# EasyEDA Pro project 物流车.epro, schematic Schematic1
Board Name: Board1; Create Date: 2026-05-04; Page Name: P1; Project Name: 集成板; Schematic Name: Schematic1; Update Date: 2026-05-04; Add into BOM: yes; Company: 嘉立创EDA; Convert to PCB: yes; Page Size: A4; Version: V1.0
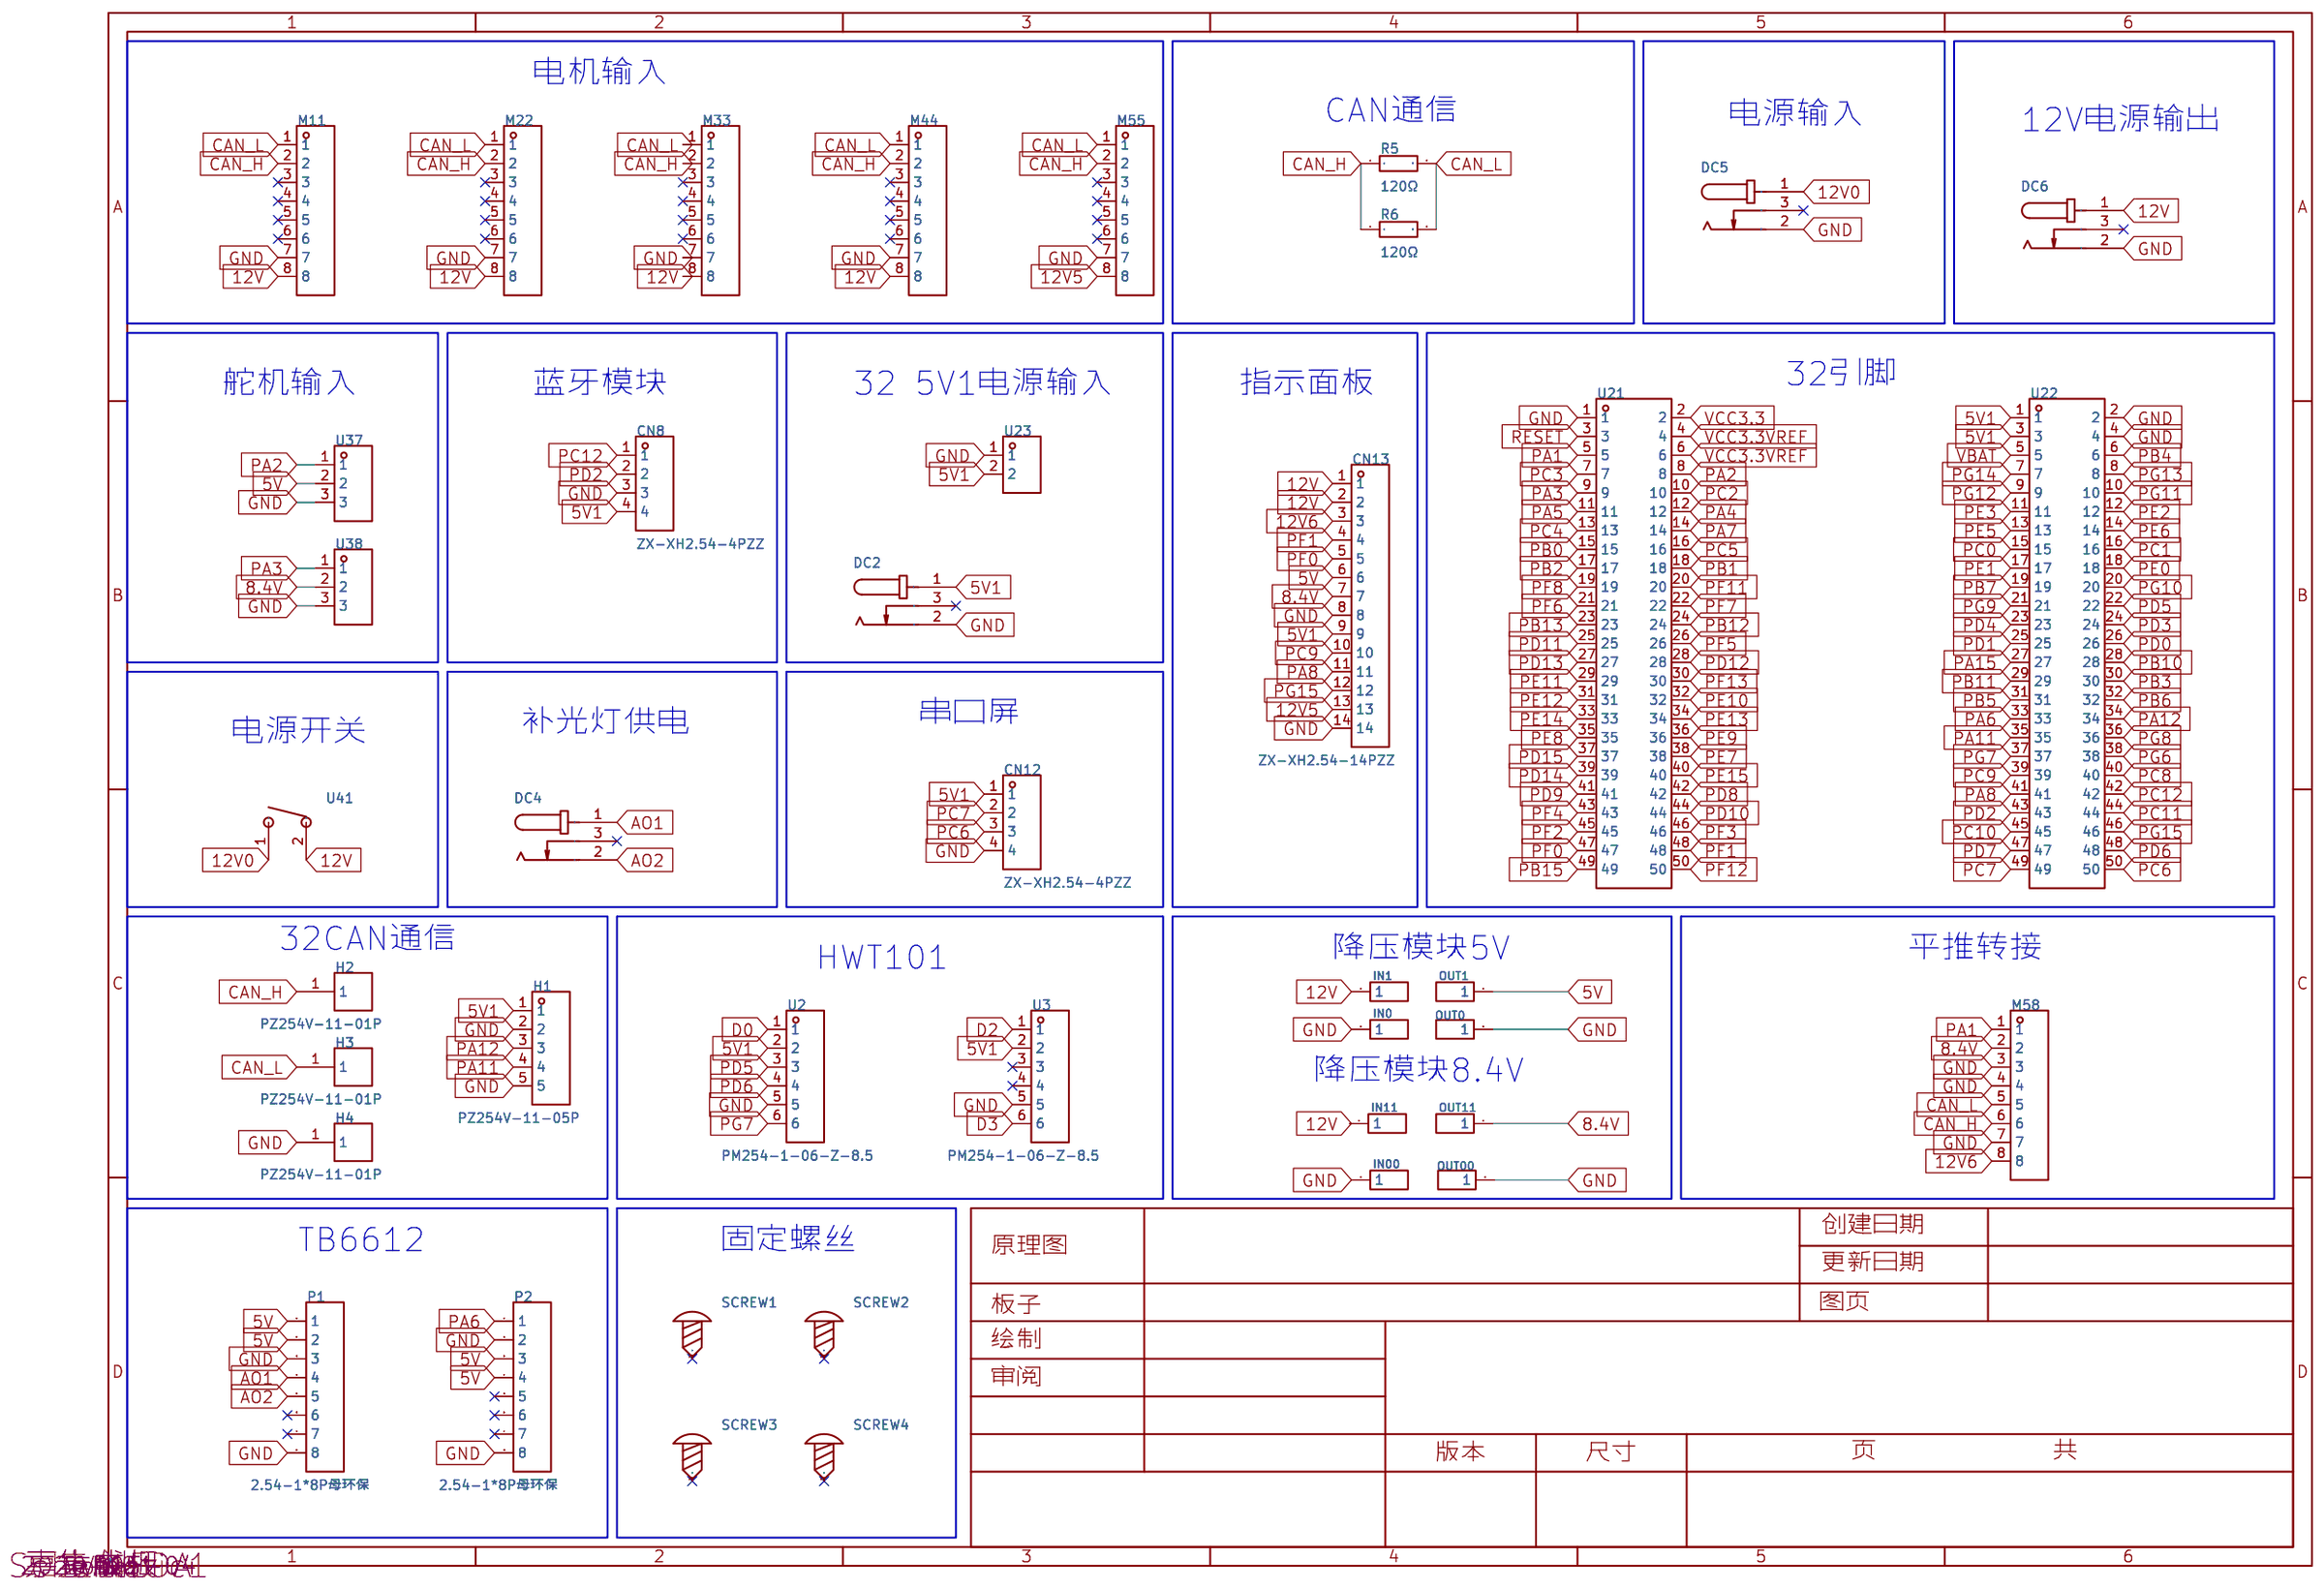
[diagram p0: schematic sheet]

## Parts
CN8  ZX-XH2.54-4PZZ  [CONN-TH_4P-P2.50_4PIN]
CN12  ZX-XH2.54-4PZZ  [CONN-TH_4P-P2.50_4PIN]
CN13  ZX-XH2.54-14PZZ  [CONN-TH_14P-P2.50_ZX-XH2.54-14PZZ]
DC2  DC-005-A200  [DC-IN-TH_DC-005-A200]
DC4  DC-005-A200  [DC-IN-TH_DC-005-A200]
DC5  DC-005-A200  [DC-IN-TH_DC-005-A200]
DC6  DC-005-A200  [DC-IN-TH_DC-005-A200]
H1  PZ254V-11-05P  [HDR-TH_5P-P2.54-V-M]
H2  PZ254V-11-01P  [HDR-TH_1P-P2.54-V-M]
H3  PZ254V-11-01P  [HDR-TH_1P-P2.54-V-M]
H4  PZ254V-11-01P  [HDR-TH_1P-P2.54-V-M]
IN0  2.54-1*1P针  [HDR-TH_1P-P2.54-V-M]
IN00  2.54-1*1P针  [HDR-TH_1P-P2.54-V-M]
IN1  2.54-1*1P针  [HDR-TH_1P-P2.54-V-M]
IN11  2.54-1*1P针  [HDR-TH_1P-P2.54-V-M]
M11  ZX-XH2.54-8PZZ  [CONN-TH_8P-P2.50-XH2.54-8P]
M22  ZX-XH2.54-8PZZ  [CONN-TH_8P-P2.50-XH2.54-8P]
M33  ZX-XH2.54-8PZZ  [CONN-TH_8P-P2.50-XH2.54-8P]
M44  ZX-XH2.54-8PZZ  [CONN-TH_8P-P2.50-XH2.54-8P]
M55  ZX-XH2.54-8PZZ  [CONN-TH_8P-P2.50-XH2.54-8P]
M58  ZX-XH2.54-8PZZ  [CONN-TH_8P-P2.50-XH2.54-8P]
OUT0  2.54-1*1P针  [HDR-TH_1P-P2.54-V-M]
OUT00  2.54-1*1P针  [HDR-TH_1P-P2.54-V-M]
OUT1  2.54-1*1P针  [HDR-TH_1P-P2.54-V-M]
OUT11  2.54-1*1P针  [HDR-TH_1P-P2.54-V-M]
P1  2.54-1*8P母环保  [HDR-TH_8P-P2.54-V-F-1]
P2  2.54-1*8P母环保  [HDR-TH_8P-P2.54-V-F-1]
R5  120Ω  [R0805]
R6  120Ω  [R0805]
SCREW1  -  [M3螺丝]
SCREW2  -  [M3螺丝]
SCREW3  -  [M3螺丝]
SCREW4  -  [M3螺丝]
U2  PM254-1-06-Z-8.5  [hdr-th_6p-p2.54-v-f]
U3  PM254-1-06-Z-8.5  [hdr-th_6p-p2.54-v-f]
U21  ZX-PM2.54-2-25PY  [HDR-TH_50P-P2.54-V-F-R2-C25-S2.54-1]
U22  ZX-PM2.54-2-25PY  [HDR-TH_50P-P2.54-V-F-R2-C25-S2.54-1]
U23  WAFER-PH2.0-2PZZ  [CONN-TH_2P-P2.00_HC-PH-2A-M]
U37  HB-PH3-25413PB2GOP  [HDR-TH_3P-P2.54-V-M]
U38  HB-PH3-25413PB2GOP  [HDR-TH_3P-P2.54-V-M]
U41  SS11-RBIWG-R20-R  [sw-th_l21.0-w15.0_ss11-rbiwg-r20-r]

## Library data of the parts
CN8 CN12 = ZX-XH2.54-4PZZ: 插针结构:1x4P;间距:2.54mm;安装方式:直插;参考系列:XH;总PIN数:4P;排数:1;每排PIN数:4;行距:-;额定电流:3A;触头材质:黄铜;触头镀层:锡;工作温度范围:-25℃~+85℃;; Supplier Part: C7429634; Manufacturer: Megastar(兆星); Supplier Footprint: 插件,P=2.54mm; JLCPCB Part Class: 扩展库; Datasheet: https://atta.szlcsc.com/upload/public/pdf/source/20230619/B529A2163E0159A644AB3383D208FB03.pdf; Supplier: LCSC; Pins Structure: 1x4P; Pitch: 2.54mm; Mounting Style: 直插; Reference Series: XH; Number of Pins: 4P; Number of Rows: 1; Number of PINs Per Row: 4; Current Rating (Max): 3A; Contact Material: 黄铜; Contact Plating: 锡; Operating Temperature Range: -25℃~+85℃
CN13 = ZX-XH2.54-14PZZ: 插针结构:1x14P;间距:2.5mm;安装方式:直插;参考系列:XH;总PIN数:14P;排数:1;每排PIN数:14;行距:-;额定电流:3A;触头材质:黄铜;触头镀层:锡;工作温度范围:-25℃~+85℃;; LCSC Part Name: 1x14P 间距:2.5mm 直插 系列:XH; Supplier Part: C22366170; Manufacturer: Megastar(兆星); Supplier Footprint: 插件,P=2.54mm; JLCPCB Part Class: 扩展库; Datasheet: https://atta.szlcsc.com/upload/public/pdf/source/20240326/867C2E693C2B8D00E51A366B538343B4.pdf; Supplier: LCSC; Pins Structure: 1x14P; Pitch: 2.5mm; Mounting Type: 直插; Reference Series: XH; Number of Pins: 14P; Number of Rows: 1; Number of PINs Per Row: 14; Rated Current: 3A; Contact Material: 黄铜; Contact Plating: 锡; Operating Temperature: -25℃~+85℃; Rated Voltage (Max): 250V; Plastic Material: PA66; Flame Retardant Rating: UL94V-0; Color: 白色; Z-Height of the Board: 7mm; X-Length of Bottom Edge on Board (Spacing Line): 37.5mm; Y-Width of Bottom Edge on Board: 5.9mm
DC2 DC4-DC6 = DC-005-A200: 连接器类型:DC电源插座;安装方式:弯插;触点内径:2mm;触点外径:6.4mm;额定电流:3A;额定电压:30V;工作温度范围:-20℃~+70℃;; LCSC Part Name: DC电源插座 内径:2mm 外径:6.4mm; Supplier Part: C720557; Manufacturer: XUNPU(讯普); Supplier Footprint: 插件; Datasheet: https://atta.szlcsc.com/upload/public/pdf/source/20200812/C720557_2286DFCD6C75B71AF905731F627ABF3A.pdf; Supplier: LCSC; Connector Type: DC电源插座; Mounting Style: 弯插; Inside Contact Diameter: 2mm; Outside Contact Diameter: 6.4mm; Current Rating (Max): 3A; Voltage Rating (Max): 30V; Operating Temperature Range: -20℃~+70℃
H1 = PZ254V-11-05P: 插针结构:1x5P;间距:2.54mm;行距:-;圆针/方针:方针;安装类型:直插;排数:单排;总PIN位数:5P;额定电流:-;额定电压:-;配合针长度:6mm;塑高:2.5mm;端接针长度:3mm;触头材质:黄铜;触头镀层:-;工作温度范围:-40℃~+105℃;颜色:黑色;; LCSC Part Name: 间距:2.54mm 1x5P 直插 方针; Supplier Part: C492404; Manufacturer: XFCN(兴飞); Supplier Footprint: 插件,P=2.54mm; Datasheet: https://atta.szlcsc.com/upload/public/pdf/source/20200309/C492404_E51533260F8710EFF5D4617281164C1D.pdf; Supplier: LCSC; Pin Structure: 1x5P; Pitch: 2.54mm; Circluar Pins/Square Pins: 方针; Mounting Type: 直插; Number of Rows: 单排; Number of Pins: 5P; Length of Mating Pin: 6mm; Insulation Height: 2.5mm; Length of End Connection Pin: 3mm; Contact Material: 黄铜; Operating Temperature Range: -40℃~+105℃; Color: 黑色
H2-H4 = PZ254V-11-01P: 插针结构:1x1P;间距:2.54mm;行距:-;圆针/方针:方针;安装类型:直插;排数:单排;总PIN位数:1P;额定电流:-;额定电压:-;配合针长度:6mm;塑高:2.5mm;端接针长度:3mm;触头材质:黄铜;触头镀层:-;工作温度范围:-40℃~+105℃;颜色:黑色;; LCSC Part Name: 间距:2.54mm 1x1P 直插 方针; Supplier Part: C492400; Manufacturer: XFCN(兴飞); Supplier Footprint: 插件,P=2.54mm; Datasheet: https://atta.szlcsc.com/upload/public/pdf/source/20200309/C492400_46876A5B545F5AE6B8D4A09C46E276E8.pdf; Supplier: LCSC; Pin Structure: 1x1P; Pitch: 2.54mm; Circluar Pins/Square Pins: 方针; Mounting Type: 直插; Number of Rows: 单排; Number of Pins: 1P; Length of Mating Pin: 6mm; Insulation Height: 2.5mm; Length of End Connection Pin: 3mm; Contact Material: 黄铜; Operating Temperature Range: -40℃~+105℃; Color: 黑色
IN0 IN00 IN1 IN11 OUT0 OUT00 OUT1 OUT11 = 2.54-1*1P针: 插针结构:-;间距:-;行距:-;圆针/方针:-;安装类型:直插;排数:单排;总PIN位数:1P;额定电流:-;额定电压:-;配合针长度:-;塑高:-;触头材质:-;触头镀层:-;颜色:黑色;; LCSC Part Name: 直插; Supplier Part: C81276; Manufacturer: BOOMELE(博穆精密); Supplier Footprint: 插件,P=2.54mm; JLCPCB Part Class: 扩展库; Datasheet: https://atta.szlcsc.com/upload/public/pdf/source/20221018/3E9408392E35E6F57A28985E5F7BF5C9.pdf; Supplier: LCSC; Mounting Type: 直插; Number of Rows: 单排; Number of Pins: 1P; Color: 黑色
M11 M22 M33 M44 M55 M58 = ZX-XH2.54-8PZZ: 插针结构:1x8P;间距:2.54mm;安装方式:直插;参考系列:XH;总PIN数:8P;排数:1;每排PIN数:8;行距:-;额定电流:3A;触头材质:黄铜;触头镀层:锡;工作温度范围:-25℃~+85℃;; Supplier Part: C7429638; Manufacturer: Megastar(兆星); Supplier Footprint: 插件,P=2.54mm; JLCPCB Part Class: 扩展库; Datasheet: https://atta.szlcsc.com/upload/public/pdf/source/20230619/688603DEA58996C00B1F33C46797D2C3.pdf; Supplier: LCSC; Pins Structure: 1x8P; Pitch: 2.54mm; Mounting Style: 直插; Reference Series: XH; Number of Pins: 8P; Number of Rows: 1; Number of PINs Per Row: 8; Current Rating (Max): 3A; Contact Material: 黄铜; Contact Plating: 锡; Operating Temperature Range: -25℃~+85℃
P1 P2 = 2.54-1*8P母环保: 插孔结构:1x8P;间距:2.54mm;行距:-;安装类型:直插;排数:单排;总孔位数:8P;塑高:-;触头材质:-;触头镀层:-;; LCSC Part Name: 间距:2.54mm 1x8P 直插; Supplier Part: C27438; Manufacturer: BOOMELE(博穆精密); Supplier Footprint: 插件,P=2.54mm; JLCPCB Part Class: 扩展库; Datasheet: https://atta.szlcsc.com/upload/public/pdf/source/20231221/1CA800C6799ED97958773716FAA1BFFE.pdf; Supplier: LCSC; Holes Structure: 1x8P; Pitch: 2.54mm; Mounting Type: 直插; Number of Rows: 单排; Number of Holes: 8P
R5 R6 = 0805W8J0121T5E: 电阻类型:厚膜电阻;阻值:120Ω;精度:±5%;功率:125mW;最大工作电压:150V;温度系数:±100ppm/℃;; LCSC Part Name: 120Ω ±5% 125mW 厚膜电阻; Supplier Part: C25280; Manufacturer: UNI-ROYAL(厚声); Supplier Footprint: 0805; JLCPCB Part Class: 扩展库; Datasheet: https://atta.szlcsc.com/upload/public/pdf/source/20200306/C422600_1E6D84923E4A46A82E41ADD87F860B5C.pdf; Supplier: LCSC; Type: 厚膜电阻; Tolerance: ±5%; Power(Watts): 125mW; Overload Voltage (Max): 150V; Temperature Coefficient: ±100ppm/℃; Operating Temperature Range: -55℃~+155℃
SCREW1-SCREW4 = M3螺丝: Supplier Footprint: 插件
U2 U3 = PM254-1-06-Z-8.5: 插孔结构:1x6P;间距:2.54mm;行距:-;圆孔/方孔:方孔;安装类型:直插;排数:单排;总孔位数:6P;额定电流:3A;额定电压:-;插孔方向:顶部;塑高:8.5mm;触头材质:铜合金;工作温度范围:-40℃~+105℃;焊接温度(最大值):260℃@5S;; LCSC Part Name: 1x6P 间距:2.54mm 直插; Supplier Part: C2897369; Manufacturer: HCTL(华灿天禄); Supplier Footprint: 插件,P=2.54mm; JLCPCB Part Class: 扩展库; Datasheet: https://atta.szlcsc.com/upload/public/pdf/source/20230609/534BE42964C679BDE98E061007C4ABD6.pdf; Supplier: LCSC; Holes Structure: 1x6P; Pitch: 2.54mm; Circular Hole / Square Hole: 方孔; Mounting Type: 直插; Number of Rows: 单排; Number of Holes: 6P; Current Rating (Max): 3A; Holes Direction: 顶部; Insulation Height: 8.5mm; Contact Material: 铜合金; Operating Temperature Range: -40℃~+105℃; Soldering Temperature(Max): 260℃@5S
U21 U22 = ZX-PM2.54-2-25PY: 插孔结构:2x25P;间距:2.54mm;行距:2.54mm;圆孔/方孔:方孔;安装类型:直插;排数:双排;总孔位数:50P;额定电流:-;额定电压:1kV;插孔方向:顶部;塑高:8.5mm;触头材质:-;触头镀层:金;工作温度范围:-40℃~+105℃;焊接温度(最大值):260℃@5S;; LCSC Part Name: 2x25P 间距:2.54mm 直插; Supplier Part: C7499355; Manufacturer: Megastar(兆星); Supplier Footprint: 插件,P=2.54mm; JLCPCB Part Class: 扩展库; Datasheet: https://atta.szlcsc.com/upload/public/pdf/source/20231122/49E5BFC403566950E1C41AC60FCE7E93.pdf; Supplier: LCSC; Holes Structure: 2x25P; Pitch: 2.54mm; Row Spacing: 2.54mm; Circular Hole / Square Hole: 方孔; Mounting Type: 直插; Number of Rows: 双排; Number of Holes: 50P; Voltage Rating (Max): 1kV; Holes Direction: 顶部; Insulation Height: 8.5mm; Contact Plating: 金; Operating Temperature Range: -40℃~+105℃; Soldering Temperature(Max): 260℃@5S
U23 = WAFER-PH2.0-2PZZ: 插针结构:1x2P;间距:2mm;安装方式:直插;参考系列:PH;总PIN数:2P;排数:1;每排PIN数:2;额定电流:2A;工作温度范围:-25℃~+85℃;; LCSC Part Name: PH 2.0mm 1x2P 直插; Supplier Part: C5359599; Manufacturer: XUNPU(讯普); Supplier Footprint: 插件,P=2mm; JLCPCB Part Class: 扩展库; Supplier: LCSC; Pins Structure: 1x2P; Pitch: 2mm; Mounting Style: 直插; Reference Series: PH; Number of Pins: 2P; Number of Rows: 1; Number of PINs Per Row: 2; Current Rating (Max): 2A; Operating Temperature Range: -25℃~+85℃
U37 U38 = HB-PH3-25413PB2GOP: 插针结构:1x3P;间距:2.54mm;行距:2.54mm;圆针/方针:方针;安装类型:直插;排数:单排;总PIN位数:3P;额定电流:3A;额定电压:250V;配合针长度:6mm;塑高:2.54mm;端接针长度:3mm;触头材质:黄铜;触头镀层:金;工作温度范围:-40℃~+105℃;焊接温度(最大值):260℃;颜色:黑色;; LCSC Part Name: 间距:2.54mm 1x3P 直插 方针; Supplier Part: C6332196; Manufacturer: HANBO(汉博); Supplier Footprint: 插件,P=2.54mm; Datasheet: https://atta.szlcsc.com/upload/public/pdf/source/20230803/F72D259687963761DF1B552F3BB84A31.pdf; Supplier: LCSC; Pin Structure: 1x3P; Pitch: 2.54mm; Row Spacing: 2.54mm; Circluar Pins/Square Pins: 方针; Mounting Type: 直插; Number of Rows: 单排; Number of Pins: 3P; Current Rating (Max): 3A; Voltage Rating (Max): 250V; Length of Mating Pin: 6mm; Insulation Height: 2.54mm; Length of End Connection Pin: 3mm; Contact Material: 黄铜; Contact Plating: 金; Operating Temperature Range: -40℃~+105℃; Soldering Temperature(Max): 260℃; Color: 黑色
U41 = SS11-RBIWG-R20-R: 带灯:无;额定电流:16A;额定电压(AC):250V;电路结构:单刀单掷;机械寿命:1万次;; LCSC Part Name: 翘板开关船型开关 电源开关; Supplier Part: C5186963; Manufacturer: Legion(六钧); Supplier Footprint: 插件; JLCPCB Part Class: 扩展库; Datasheet: https://atta.szlcsc.com/upload/public/pdf/source/20221116/4827089DB39A8210C60F541CC13B896F.pdf; Supplier: LCSC; Switch Length: 21mm; Switch Width: 15mm; Actuator Type: 凹面弯曲; With Lamp: 无; Actuator Color: 红色; Contact Current: 16A; Voltage Rating (AC): 250V; Circuit: 单刀单掷; Mechanical Life: 1万次; Operating Temperature: -40℃~+125℃; Actuator Identifier: - O

## Nets
5V: CN13.6 OUT1.1 P1.1 P1.2 P2.3 P2.4 U37.2
5V1: CN8.4 CN12.1 CN13.9 DC2.1 H1.1 U2.2 U3.2 U22.1 U22.3 U23.2
8.4V: CN13.7 M58.2 OUT11.1 U38.2
12V: CN13.1 CN13.2 DC6.1 IN1.1 IN11.1 M11.8 M22.8 M33.8 M44.8 U41.2
12V0: DC5.1 U41.1
12V5: CN13.13 M55.8
12V6: CN13.3 M58.8
GND: CN8.3 CN12.4 CN13.8 CN13.14 DC2.2 DC5.2 DC6.2 H1.2 H1.5 H4.1 IN0.1 IN00.1 M11.7 M22.7 M33.7 M44.7 M55.7 M58.3 M58.4 M58.7 OUT0.1 OUT00.1 P1.3 P1.8 P2.2 P2.8 U2.5 U3.5 U21.1 U22.2 U22.4 U23.1 U37.3 U38.3
VBAT: U22.5
VCC3.3: U21.2
VCC3.3VREF: U21.4 U21.6
AO1: DC4.1 P1.4
AO2: DC4.2 P1.5
CAN_H: H2.1 M11.2 M22.2 M33.2 M44.2 M55.2 M58.6 R5.1 R6.1
CAN_L: H3.1 M11.1 M22.1 M33.1 M44.1 M55.1 M58.5 R5.2 R6.2
D0: U2.1
D2: U3.1
D3: U3.6
PA1: M58.1 U21.5
PA2: U21.8 U37.1
PA3: U21.9 U38.1
PA4: U21.12
PA5: U21.11
PA6: P2.1 U22.33
PA7: U21.14
PA8: CN13.11 U22.41
PA11: H1.4 U22.35
PA12: H1.3 U22.34
PA15: U22.27
PB0: U21.15
PB1: U21.18
PB2: U21.17
PB3: U22.30
PB4: U22.6
PB5: U22.31
PB6: U22.32
PB7: U22.19
PB10: U22.28
PB11: U22.29
PB12: U21.24
PB13: U21.23
PB15: U21.49
PC0: U22.15
PC1: U22.16
PC2: U21.10
PC3: U21.7
PC4: U21.13
PC5: U21.16
PC6: CN12.3 U22.50
PC7: CN12.2 U22.49
PC8: U22.40
PC9: CN13.10 U22.39
PC10: U22.45
PC11: U22.44
PC12: CN8.1 U22.42
PD0: U22.26
PD1: U22.25
PD2: CN8.2 U22.43
PD3: U22.24
PD4: U22.23
PD5: U2.3 U22.22
PD6: U2.4 U22.48
PD7: U22.47
PD8: U21.42
PD9: U21.41
PD10: U21.44
PD11: U21.25
PD12: U21.28
PD13: U21.27
PD14: U21.39
PD15: U21.37
PE0: U22.18
PE1: U22.17
PE2: U22.12
PE3: U22.11
PE5: U22.13
PE6: U22.14
PE7: U21.38
PE8: U21.35
PE9: U21.36
PE10: U21.32
PE11: U21.29
PE12: U21.31
PE13: U21.34
PE14: U21.33
PE15: U21.40
PF0: CN13.5 U21.47
PF1: CN13.4 U21.48
PF2: U21.45
PF3: U21.46
PF4: U21.43
PF5: U21.26
PF6: U21.21
PF7: U21.22
PF8: U21.19
PF11: U21.20
PF12: U21.50
PF13: U21.30
PG6: U22.38
PG7: U2.6 U22.37
PG8: U22.36
PG9: U22.21
PG10: U22.20
PG11: U22.10
PG12: U22.9
PG13: U22.8
PG14: U22.7
PG15: CN13.12 U22.46
RESET: U21.3

Not connected (* = marked no-connect by the designer): DC2 3*; DC4 3*; DC5 3*; DC6 3*; M11 3* 4* 5* 6*; M22 3* 4* 5* 6*; M33 3* 4* 5* 6*; M44 3* 4* 5* 6*; M55 3* 4* 5* 6*; P1 6* 7*; P2 5* 6* 7*; SCREW1 1*; SCREW2 1*; SCREW3 1*; SCREW4 1*; U3 3* 4*

## Notes on the sheet
- 电机输入
- CAN通信
- 电源输入
- 12V电源输出
- 舵机输入
- 蓝牙模块
- 32 5V1电源输入
- 指示面板
- 32引脚
- 串口屏
- 电源开关
- 补光灯供电
- 32CAN通信
- HWT101
- 降压模块5V
- 平推转接
- 降压模块8.4V
- TB6612
- 固定螺丝
